# Altium schematic sheet Sensor_LSM6DSV32X.SchDoc: Sensors - IMU 1 LSM6DSV32X (SPI1)
size A3; ApprovedBy: Weymen Koo; CheckedBy: -; DrawnBy: Weymen Koo; DocumentNumber: UBCAD-FCSOM-SCH; Revision: A; SheetNumber: 5; SheetTotal: 18; ProjectTitle: Flight Controller SoM; Status: PRELIMINARY; ReleaseDate: 2026-11-14
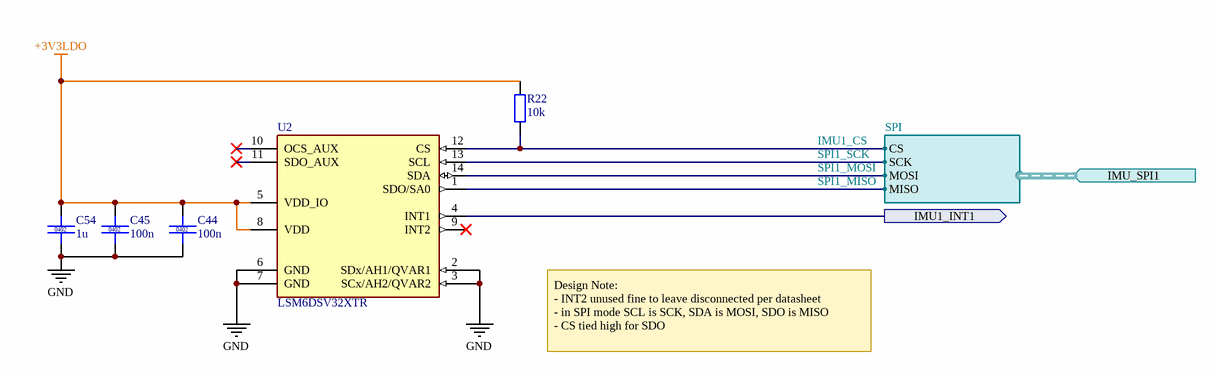
[diagram p0: Sensor_LSM6DSV32X.SchDoc]

## Parts
C44  100n  [CAPC1005X05N]
C45  100n  [CAPC1005X05N]
C54  1u  [CAPC1005X05N]
R22  10k  [IPC C R0402 NO SILK]
U2  LSM6DSV32XTR  [LGA-14L_L3.0-W2.5-P0.50-TL]

## Ports
IMU1_INT1 (out, see 1[5A], 4[9B]), IMU_SPI1 (in, harness SPI, see 1[5A], 4[9B])

## Harnesses
SPI: CS, SCK, MOSI, MISO

## Nets
+3V3LDO: C44.1 C45.1 C54.1 R22.2 U2.5(VDD_IO) U2.8(VDD)
GND: C44.2 C45.2 C54.2 U2.2(SDx/AH1/QVAR1) U2.3(SCx/AH2/QVAR2) U2.6(GND) U2.7(GND)
IMU1_CS: R22.1 U2.12(CS) ; port IMU_SPI1.CS
IMU1_INT1: U2.4(INT1) ; port IMU1_INT1
SPI1_MISO: U2.1(SDO/SA0) ; port IMU_SPI1.MISO
SPI1_MOSI: U2.14(SDA) ; port IMU_SPI1.MOSI
SPI1_SCK: U2.13(SCL) ; port IMU_SPI1.SCK

Not connected (* = marked no-connect by the designer): U2 9(INT2)* 10(OCS_AUX)* 11(SDO_AUX)*

## Notes on the sheet
- Design Note:
  - INT2 unused fine to leave disconnected per datasheet
  - in SPI mode SCL is SCK, SDA is MOSI, SDO is MISO
  - CS tied high for SDO
- PROJECT
- KEY
- POWER
- 5 V class
- 3.3 V class
- Core / SMPS
- GND
- SHEET TITLE
- SIGNALS
- NOTES
- SPI
- Analog
- Design
- I2C
- PWM/Timer
- Layout
- UART/RC
- GPIO/Ctrl
- Assembly
- CAN
- Unused pin
- Firmware
- USB/SD/Clk
- Critical
- DRAWN
- DOCUMENT NO.
- CHECKED
- REV
- STATUS
- APPROVED
- DATE
- FILE
- SIZE
- A3
- SHEET
- of

## Library data of the parts
C44 C45 = CMP-002-000094-5: CAP 100n 16V X7R 10% 0402; Manufacturer: Samsung; Manufacturer Part Number: CL05B104KO5NNNC; Value: 100n; Tolerance: 10%; Package: 0402; Voltage: 16V; Dielectric: X7R; LCSC Part #: C1525
C54 = CMP-002-000094-5: CAP 1u 25V X5R 10% 0402; Manufacturer: Samsung; Manufacturer Part Number: CL05A105KA5NQNC; Value: 1u; Tolerance: 10%; Package: 0402; Voltage: 25V; Dielectric: X5R; LCSC Part #: C52923
R22 = CMP-008-000000-2: RES 10k 1% 1/16W 0402; Manufacturer: UNI-ROYAL; Manufacturer Part Number: 0402WGF1002TCE; Value: 10k; Source: Schlib1.SchLib; Design Item ID: Generic RES 0402; Package: 0402; Tolerance: 1%; Power: 1/16W; LCSC Part #: C25744
U2 = CMP-292-000005-1: IMU, 6-axis, +/-32 g, +/-4000 dps, SPI/I2C, LGA-14; Design Item ID: IMU_LSM6DSV32X; Source: CRLS Lib.SchLib; Component Type: Standard; Pin Count: 14